# Altium schematic sheet Power Supplies.SchDoc: Power Supplies
size A4; DrawnBy: AT; SheetNumber: 4; SheetTotal: 5
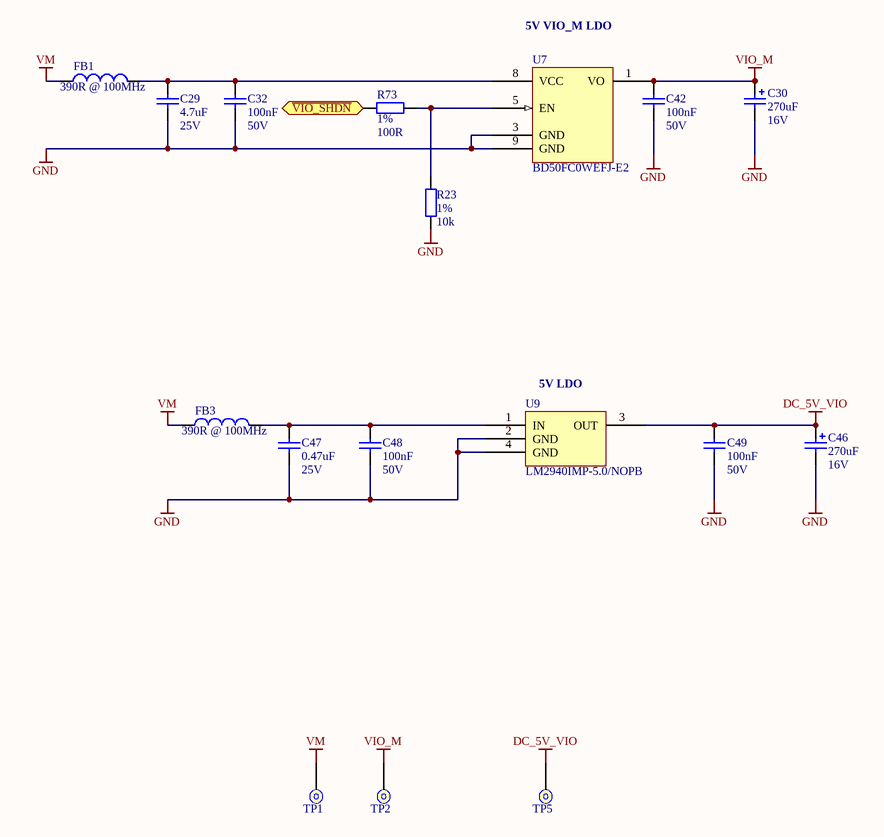
[diagram p0: Power Supplies.SchDoc]

## Parts
C29  value 4.7uF  Voltage: 25V  [C0603]  (hidden comment: 4.7uF 0603 Ceramic Capacitor, 10%, 25V)
C30  value 270uF  Voltage: 16V  [RADIAl-CAN-6.3MM-DIA]  (hidden comment: CAP ALUM 270UF 20% 16V SMD)
C32  value 100nF  Voltage: 50V  [C0603]  (hidden comment: 100nF 0603 Ceramic Capacitor, 10%, X7R, 50V)
C42  value 100nF  Voltage: 50V  [C0603]  (hidden comment: 100nF 0603 Ceramic Capacitor, 10%, X7R, 50V)
C46  value 270uF  Voltage: 16V  [RADIAl-CAN-6.3MM-DIA]  (hidden comment: CAP ALUM 270UF 20% 16V SMD)
C47  value 0.47uF  Voltage Rating: 25V  [C0603]  (hidden comment: 0.47uF 0603 Ceramic Capacitor, 10%, 25V, X7R)
C48  value 100nF  Voltage: 50V  [C0603]  (hidden comment: 100nF 0603 Ceramic Capacitor, 10%, X7R, 50V)
C49  value 100nF  Voltage: 50V  [C0603]  (hidden comment: 100nF 0603 Ceramic Capacitor, 10%, X7R, 50V)
FB1  value 390R @ 100MHz  [R1206]  (hidden comment: FERRITE BEAD 390 OHM 1206 1LN)
FB3  value 390R @ 100MHz  [R1206]  (hidden comment: FERRITE BEAD 390 OHM 1206 1LN)
R23  value 10k  Tolerance: 1%  [R0603]  (hidden comment: 10k 0603 Chip Resistor, 1%, 0.1W)
R73  value 100R  Tolerance: 1%  [R0603]  (hidden comment: 100R 0603 Chip Resistor, 1%, 0.1W)
TP1  Test Point PTH  [Solder Point - 0.8mm Drill]  (value not drawn)  (no BOM)
TP2  Test Point PTH  [Solder Point - 0.8mm Drill]  (value not drawn)  (no BOM)
TP5  Test Point PTH  [Solder Point - 0.8mm Drill]  (value not drawn)  (no BOM)
U7  BD50FC0WEFJ-E2  [SO8_N-EP-ROHM]
U9  LM2940IMP-5.0/NOPB  [SOT223]

## Ports
~{VIO_SHDN} (in)

## Nets
DC_5V_VIO: C46.+ C49.2 TP5.1 U9.3(OUT)
GND: C29.1 C30.- C32.1 C42.1 C46.- C47.1 C48.1 C49.1 R23.1 U7.3(GND) U7.9(GND) U9.2(GND) U9.4(GND)
VIO_M: C30.+ C42.2 TP2.1 U7.1(VO)
VM: FB1.1 FB3.1 TP1.1
~{VIO_SHDN}: R73.1 ; port ~{VIO_SHDN}
NetC29_2: C29.2 C32.2 FB1.2 U7.8(VCC)
NetC47_2: C47.2 C48.2 FB3.2 U9.1(IN)
NetR23_2: R23.2 R73.2 U7.5(EN)

## Notes on the sheet
- (near U7) 5V VIO_M LDO
- (near U9) 5V LDO
- Title
- Size:
- Date:
- A4
- Drawn By:
- Time:
- Revision:
- Sheet
- of
- CircuitBuilder
- +44 (0)330 133 0606
- info@circuit-builder.com
- File:

## Library data of the parts
C29 = 4.7uF 0603 Ceramic Capacitor, 10%, 25V_1: Manufacturer: Samsung Electro-Mechanics America, Inc; ManufacturerPN: CL10A475KA8NQNC; Flex Part Number: ROL-F120-0783; Cost-10000: 0.04744; Supplier1: Digikey; Supplier1PN: 1276-1900-2-ND; Cost: 0.22; Package: 0603; Tolerance: 10%; Supplier2: Open Market; Supplier1PNProto: 1276-1900-1-ND
C30 C46 = CAP ALUM 270UF 20% 16V SMD: 270µF 16V Aluminum Polymer Capacitor Radial, Can - SMD 10mOhm 5000 Hrs @ 105°C; Manufacturer: Panasonic Electronic Components; ManufacturerPN: 16SVPG270MX; Cost-10000: 0.47; Supplier1: Digikey; Supplier1PN: P123389CT-ND; Supplier2: Open Market; Cost: 1.51; Tolerance: 20%; Supplier1PNProto: P123389TR-ND
C32 C42 C48 C49 = 100nF 0603 Ceramic Capacitor, 10%, X7R, 50V: Manufacturer: AVX; ManufacturerPN: 06035C104KAZ2A; Cost-10000: 0.0192; Supplier1: Farnell; Supplier1PN: 1301894; Cost: 0.0671; Package: 0603; Tolerance: 10%; Supplier2: Open Market; Supplier1PNProto: 1301894
C47 = 0.47uF 0603 Ceramic Capacitor, 10%, 25V, X7R: Manufacturer: Murata Electronics; ManufacturerPN: GRM188R71E474KA12D; Cost-10000: 0.04; Supplier1: Digikey; Supplier1PN: 490-3291-2-ND; Cost: 0.21; Package: 0603; Tolerance: 10%; Supplier1PNProto: 490-3291-1-ND; CreatedBy: AT
FB1 FB3 = FERRITE BEAD 390 OHM 1206 1LN: 390 Ohms @ 100MHz 1 Power Line Ferrite Bead 1206 (3216 Metric) 2A 50mOhm; Manufacturer: Murata Electronics; ManufacturerPN: BLM31PG391SN1L; Cost-10000: 0.07; Supplier1: Digikey; Supplier1PN: 490-5229-2-ND; Cost: 0.26; Supplier1PNProto: 490-5229-1-ND
R23 = 10k 0603 Chip Resistor, 1%, 0.1W: Manufacturer: Samsung Electro-Mechanics America, Inc; ManufacturerPN: RC1608F103CS; Cost-10000: 0.00095; ProductionCost: 0.0012; Supplier1: Digikey; Supplier1PN: 1276-3485-2-ND; Cost: 0.07; Supplier1PNProto: 1276-3485-1-ND; ProductionSupplier: LCSC; ProductionSupplierPN: C115324; Supplier2: Open Market
R73 = 100R 0603 Chip Resistor, 1%, 0.1W: Manufacturer: Yageo; ManufacturerPN: RC0603FR-07100RL; Cost-10000: 0.003; ProductionCost: 0.0016; Supplier1: Digikey; Supplier1PN: 311-100HRTR-ND; Cost: 0.08; Supplier2: Open Market; Supplier1PNProto: 311-100HRCT-ND; ProductionSupplier: LCSC; ProductionSupplierPN: C105588
U7 = BD50FC0WEFJ-E2: Linear Voltage Regulator IC Positive Fixed 5V Output 1A 8-HTSOP-J; Manufacturer: Rohm Semiconductor; Cost-10000: 0.42; ManufacturerPN: BD50FC0WEFJ-E2; Supplier1: Digikey; Supplier1PN: BD50FC0WEFJ-E2CT-ND; Cost: 0.93; Supplier1PNProto: BD50FC0WEFJ-E2CT-ND
U9 = LM2940IMP-5.0/NOPB: Linear Voltage Regulator IC 5V Output 1A SOT-223-4; Manufacturer: Texas Instruments; Cost-10000: 0.73; ManufacturerPN: LM2940IMP-5.0/NOPB; Supplier1: Digikey; Supplier1PN: LM2940IMP-5.0/NOPBTR-ND; Cost: 1.79; Package: SOT223; Supplier1PNProto: LM2940IMP-5.0/NOPBCT-ND